# EAGLE design AquisitionBoardV2 (EAGLE 9.6.2)
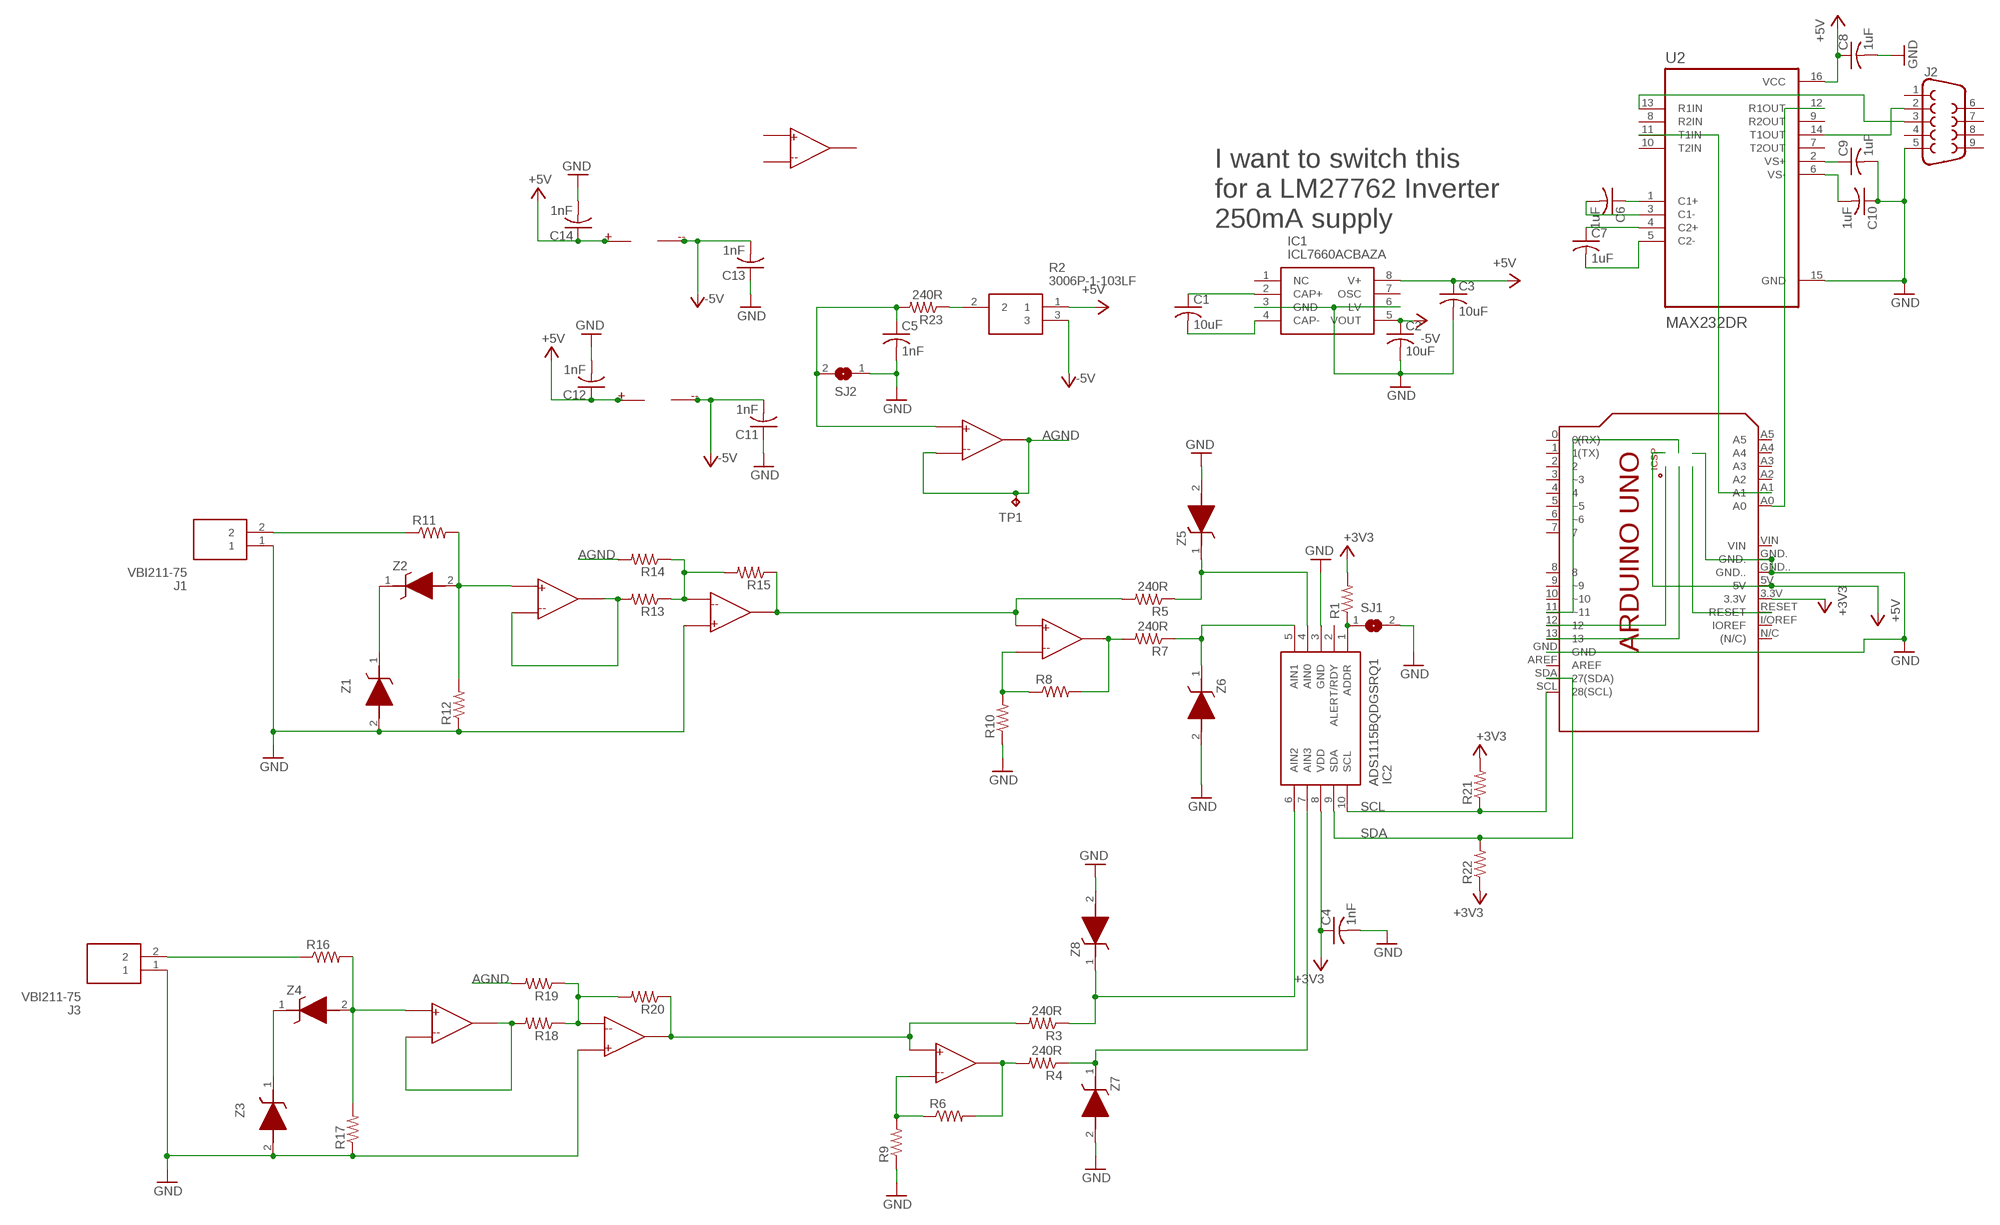
[diagram p0: schematic, sheet 1]

## Parts
C1  10uF  C-USC0603  [C0603]
C2  10uF  C-USC0603  [C0603]
C3  10uF  C-USC0603  [C0603]
C4  1nF  C-USC0603  [C0603]
C5  1nF  C-USC0603  [C0603]
C6  1uF  C-USC0603  [C0603]
C7  1uF  C-USC0603  [C0603]
C8  1uF  C-USC0603  [C0603]
C9  1uF  C-USC0603  [C0603]
C10  1uF  C-USC0603  [C0603]
C11  1nF  C-USC0603  [C0603]
C12  1nF  C-USC0603  [C0603]
C13  1nF  C-USC0603  [C0603]
C14  1nF  C-USC0603  [C0603]
IC1  ICL7660ACBAZA  [SOIC127P600X175-8N]
IC2  ADS1115BQDGSRQ1  [SOP50P490X110-10N]
J1  VBI211-75  [VBI21175]
J2  DB9MALE  [DB9_MALE]
J3  VBI211-75  [VBI21175]
PCB1  ARDUINO_UNO  [ARDUINO_UNO]
R1  R-US_R0805  [R0805]
R2  3006P-1-103LF  [3006P_1]
R3  240R  R-US_R0805  [R0805]
R4  240R  R-US_R0805  [R0805]
R5  240R  R-US_R0805  [R0805]
R6  R-US_R0805  [R0805]
R7  240R  R-US_R0805  [R0805]
R8  R-US_R0805  [R0805]
R9  R-US_R0805  [R0805]
R10  R-US_R0805  [R0805]
R11  R-US_R0805  [R0805]
R12  R-US_R0805  [R0805]
R13  R-US_R0805  [R0805]
R14  R-US_R0805  [R0805]
R15  R-US_R0805  [R0805]
R16  R-US_R0805  [R0805]
R17  R-US_R0805  [R0805]
R18  R-US_R0805  [R0805]
R19  R-US_R0805  [R0805]
R20  R-US_R0805  [R0805]
R21  R-US_R0805  [R0805]
R22  R-US_R0805  [R0805]
R23  240R  R-US_R0805  [R0805]
SJ1  SJ  [SJ]
SJ2  SJ  [SJ]
TP1  TPB1,27  [B1,27]
U2  MAX232DR  [SOIC127P600X175-16N]
U$1  OPA4227  [SOIC127P600X175-14N]
U$2  OPA4227  [SOIC127P600X175-14N]
Z1  CZRU52C4V7  [DIOM179X85N]
Z2  CZRU52C4V7  [DIOM179X85N]
Z3  CZRU52C4V7  [DIOM179X85N]
Z4  CZRU52C4V7  [DIOM179X85N]
Z5  CZRU52C4V7  [DIOM179X85N]
Z6  CZRU52C4V7  [DIOM179X85N]
Z7  CZRU52C4V7  [DIOM179X85N]
Z8  CZRU52C4V7  [DIOM179X85N]

## Nets
+3V3: C4.1 IC2.8(VDD) PCB1.3.3V R1.2 R21.2 R22.1
+5V: C3.1 C8.1 C12.1 C14.1 IC1.8(V+) PCB1.5V PCB1.+5V R2.1 U2.16(VCC) U$1.4(V+) U$2.4(V+)
-5V: C2.1 C11.2 C13.2 IC1.5(VOUT) R2.3 U$1.11(V-) U$2.11(V-)
AGND: R14.2 R19.2 TP1.TP U$2.6(A-) U$2.7(AO)
GND: C2.2 C3.2 C4.2 C5.2 C8.2 C9.2 C10.1 C11.1 C12.2 C13.1 C14.2 IC1.3(GND) IC1.6(LV) IC2.3(GND) J1.1 J2.5 J3.1 PCB1.GND PCB1.GND. PCB1.GND.. PCB1.GND_ R9.1 R10.1 R12.1 R17.1 SJ1.2 SJ2.1 U2.15(GND) U$1.5(A+) U$2.12(A+) Z1.2(A) Z3.2(A) Z5.2(A) Z6.2(A) Z7.2(A) Z8.2(A)
N$1: J1.2 R11.1
N$2: C1.1 IC1.2(CAP+)
N$3: C1.2 IC1.4(CAP-)
N$4: PCB1.RESET PCB1.RESET.
N$5: PCB1.13 PCB1.SCK
N$6: R2.2 R23.1
N$7: IC2.5(AIN1) R7.1 Z6.1(K)
N$8: IC2.4(AIN0) R5.1 Z5.1(K)
N$9: IC2.1(ADDR) R1.1 SJ1.1
N$10: C5.1 R23.2 SJ2.2 U$2.5(A+)
N$11: R5.2 R15.1 U$2.3(A+) U$2.14(AO)
N$12: R7.2 R8.2 U$2.1(AO)
N$14: R8.1 R10.2 U$2.2(A-)
N$15: IC2.6(AIN2) R3.1 Z8.1(K)
N$16: PCB1.12 PCB1.MISO
N$17: PCB1.11(~11) PCB1.MOSI
N$18: R11.2 R12.2 U$2.10(A+) Z2.2(A)
N$19: Z1.1(K) Z2.1(K)
N$20: J2.3 U2.13(R1IN)
N$21: R13.2 U$2.8(AO) U$2.9(A-)
N$22: R4.2 R6.2 U$1.8(AO)
N$23: R13.1 R14.1 R15.2 U$2.13(A-)
N$24: R6.1 R9.2 U$1.9(A-)
N$25: J2.2 U2.14(T1OUT)
N$26: J3.2 R16.1
N$27: R16.2 R17.2 U$1.3(A+) Z4.2(A)
N$28: Z3.1(K) Z4.1(K)
N$29: C6.1 U2.1(C1+)
N$30: C6.2 U2.3(C1-)
N$31: C7.1 U2.4(C2+)
N$32: C7.2 U2.5(C2-)
N$33: C9.1 U2.2(VS+)
N$34: C10.2 U2.6(VS-)
N$35: R18.2 U$1.1(AO) U$1.2(A-)
N$36: R18.1 R19.1 R20.2 U$1.6(A-)
N$37: R3.2 R20.1 U$1.7(AO) U$1.10(A+)
N$38: IC2.7(AIN3) R4.1 Z7.1(K)
N$39: PCB1.A0 U2.12(R1OUT)
N$40: PCB1.A1 U2.11(T1IN)
SCL: IC2.10(SCL) PCB1.SCL(28(SCL)) R21.1
SDA: IC2.9(SDA) PCB1.SDA(27(SDA)) R22.2
Unconnected: IC1.1(NC) IC1.7(OSC) IC2.2(ALERT/RDY) J2.1 J2.4 J2.6 J2.7 J2.8 J2.9 PCB1.0(0(RX)) PCB1.1(1(TX)) PCB1.2 PCB1.3(~3) PCB1.4 PCB1.5(~5) PCB1.6(~6) PCB1.7 PCB1.8 PCB1.9(~9) PCB1.10(~10) PCB1.A2 PCB1.A3 PCB1.A4 PCB1.A5 PCB1.AREF PCB1.I/OREF(IOREF) PCB1.N/C((N/C)) PCB1.VIN U2.7(T2OUT) U2.8(R2IN) U2.9(R2OUT) U2.10(T2IN) U$1.12(A+) U$1.13(A-) U$1.14(AO)

## Notes on the sheet
- I want to switch this
  for a LM27762 Inverter
  250mA supply

## Library data of the parts
C1-C14 = rcl:C-US: CAPACITOR, American symbol; SPICEPREFIX: C
IC1 = ICL7660ACBAZA:ICL7660ACBAZA: The ICL7660S and ICL7660A Super Voltage Converters are monolithic CMOS voltage conversion ICs that guarantee significant performance advantages over other similar devices. They are direct replacements for the industry standard ICL7660 offering an extended operating supply voltage range up to 12V, with lower supply current. A Frequency Boost pin has been incorporated to enable the user to achieve lower output impedance despite using smaller capacitors. All improvements are highlighted in the Electrical Spec Source: Datasheet <https://www.renesas.com/en-us/www/doc/datasheet/icl7660s-a.pdf>; DESCRIPTION: The ICL7660S and ICL7660A Super Voltage Converters are monolithic CMOS voltage conversion ICs that guarantee significant performance advantages over other similar devices. They are direct replacements for the industry standard ICL7660 offering an extended operating supply voltage range up to 12V, with lower supply current. A Frequency Boost pin has been incorporated to enable the user to achieve lower output impedance despite using smaller capacitors. All improvements are highlighted in the Electrical Spec; HEIGHT: 1.75mm; MANUFACTURER_NAME: Renesas Electronics; MANUFACTURER_PART_NUMBER: ICL7660ACBAZA; MOUSER_PART_NUMBER: 968-ICL7660ACBAZA; MOUSER_PRICE-STOCK: https://www.mouser.co.uk/ProductDetail/Renesas-Intersil/ICL7660ACBAZA?qs=9fLuogzTs8LeW4me0pfrFQ%3D%3D
IC2 = ADS1115BQDGSRQ1:ADS1115BQDGSRQ1: Automotive 16-Bit 860SPS 4-Ch Delta-Sigma ADC With PGA, Oscillator, VREF, Comparator, and I2C Source: Datasheet <http://www.ti.com/lit/gpn/ads1115-q1>; DESCRIPTION: Automotive 16-Bit 860SPS 4-Ch Delta-Sigma ADC With PGA, Oscillator, VREF, Comparator, and I2C; HEIGHT: 1.1mm; MANUFACTURER_NAME: Texas Instruments; MANUFACTURER_PART_NUMBER: ADS1115BQDGSRQ1; MOUSER_PART_NUMBER: 595-ADS1115BQDGSRQ1; MOUSER_PRICE-STOCK: https://www.mouser.co.uk/ProductDetail/Texas-Instruments/ADS1115BQDGSRQ1?qs=34RfhUjJmKdvyLrkbnfjHA%3D%3D
J1 J3 = VBI211-75:VBI211-75: RF Connectors / Coaxial Connectors BNC R/A PCB Mt Jack Source: Datasheet <https://www.mouser.mx/datasheet/2/643/dr-CCS-VIT-VBI211-75-1308996.pdf>; DESCRIPTION: RF Connectors / Coaxial Connectors BNC R/A PCB Mt Jack; HEIGHT: 13mm; MANUFACTURER_NAME: Cinch Connectivity Solutions; MANUFACTURER_PART_NUMBER: VBI211-75; MOUSER_PART_NUMBER: 530-VBI211-75; MOUSER_PRICE-STOCK: https://www.mouser.co.uk/ProductDetail/Vitelec-Cinch-Connectivity-Solutions/VBI211-75?qs=HAjLtCtd%252Bdatcts%2FKc37yQ%3D%3D
J2 = SparkFun-Connectors:DB9: DB9 Connector Standard DB9 (D-Sub 9) serial connector. Can be used for CAN bus as well as RS485 and RS232. Footprint production proven. Here is the female version connector we sell at SparkFun: 9 Pin Female Serial Connector - PCB Mount <https://www.sparkfun.com/products/429> (PRT-00429) This connector has been used on the following SparkFun products: SparkFun RS232 Shifter - SMD <https://www.sparkfun.com/products/449> (PRT-00449) SparkFun RS232 Shifter SMD (No DB9) <https://www.sparkfun.com/products/8780> (PRT-08780); PROD_ID: CONN-09904
PCB1 = E14_Arduino_revC:ARDUINO_UNO: Device for representing an Arduino Uno board with a footprint in an EAGLE design. Created by Dave Young for Element14. More EAGLE documentation at: http://www.element14.com/community/community/knode/cadsoft_eagle
R1 R3-R23 = rcl:R-US_: RESISTOR, American symbol; SPICEPREFIX: R
R2 = 3006P-1-103LF:3006P-1-103LF: 15 turn cermet trimmer,10K 19mm 750mW Bourns 3006 Series 15-Turn Through Hole Cermet Trimmer Resistor with Pin Terminations, 10k +/-10% 0.75W +/-100ppm/C Source: Datasheet <http://www.bourns.com/docs/Product-Datasheets/3006.pdf>; DESCRIPTION: 15 turn cermet trimmer,10K 19mm 750mW Bourns 3006 Series 15-Turn Through Hole Cermet Trimmer Resistor with Pin Terminations, 10k +/-10% 0.75W +/-100ppm/C; HEIGHT: mm; MANUFACTURER_NAME: Bourns; MANUFACTURER_PART_NUMBER: 3006P-1-103LF; MOUSER_PART_NUMBER: 652-3006P-1-103-LF; MOUSER_PRICE-STOCK: https://www.mouser.co.uk/ProductDetail/Bourns/3006P-1-103LF?qs=nlUCIKN74UBewXtW9dljOA%3D%3D
SJ1 SJ2 = jumper:SJ: SMD solder JUMPER
TP1 = testpad:TP: Test pad
U2 = MAX232DR:MAX232DR
U$1 U$2 = OPA4227UA_2K5:OPA4227
Z1-Z8 = CZRU52C4V7:CZRU52C4V7: COMCHIP TECHNOLOGY CZRU52C4V7 Zener Diode, 4.7V 150 mW SMT 2-Pin SOD-523F (0603) Source: Datasheet <https://datasheet.datasheetarchive.com/originals/distributors/Datasheets-DGA23/1545930.pdf>; DESCRIPTION: COMCHIP TECHNOLOGY CZRU52C4V7 Zener Diode, 4.7V 150 mW SMT 2-Pin SOD-523F (0603); HEIGHT: 0.85mm; MANUFACTURER_NAME: Comchip Technology; MANUFACTURER_PART_NUMBER: CZRU52C4V7; MOUSER_PART_NUMBER: 750-CZRU52C4V7; MOUSER_PRICE-STOCK: https://www.mouser.co.uk/ProductDetail/Comchip-Technology/CZRU52C4V7?qs=tw%252BuQ%2FB6PO1RrR6kVnXLIA%3D%3D

## Board
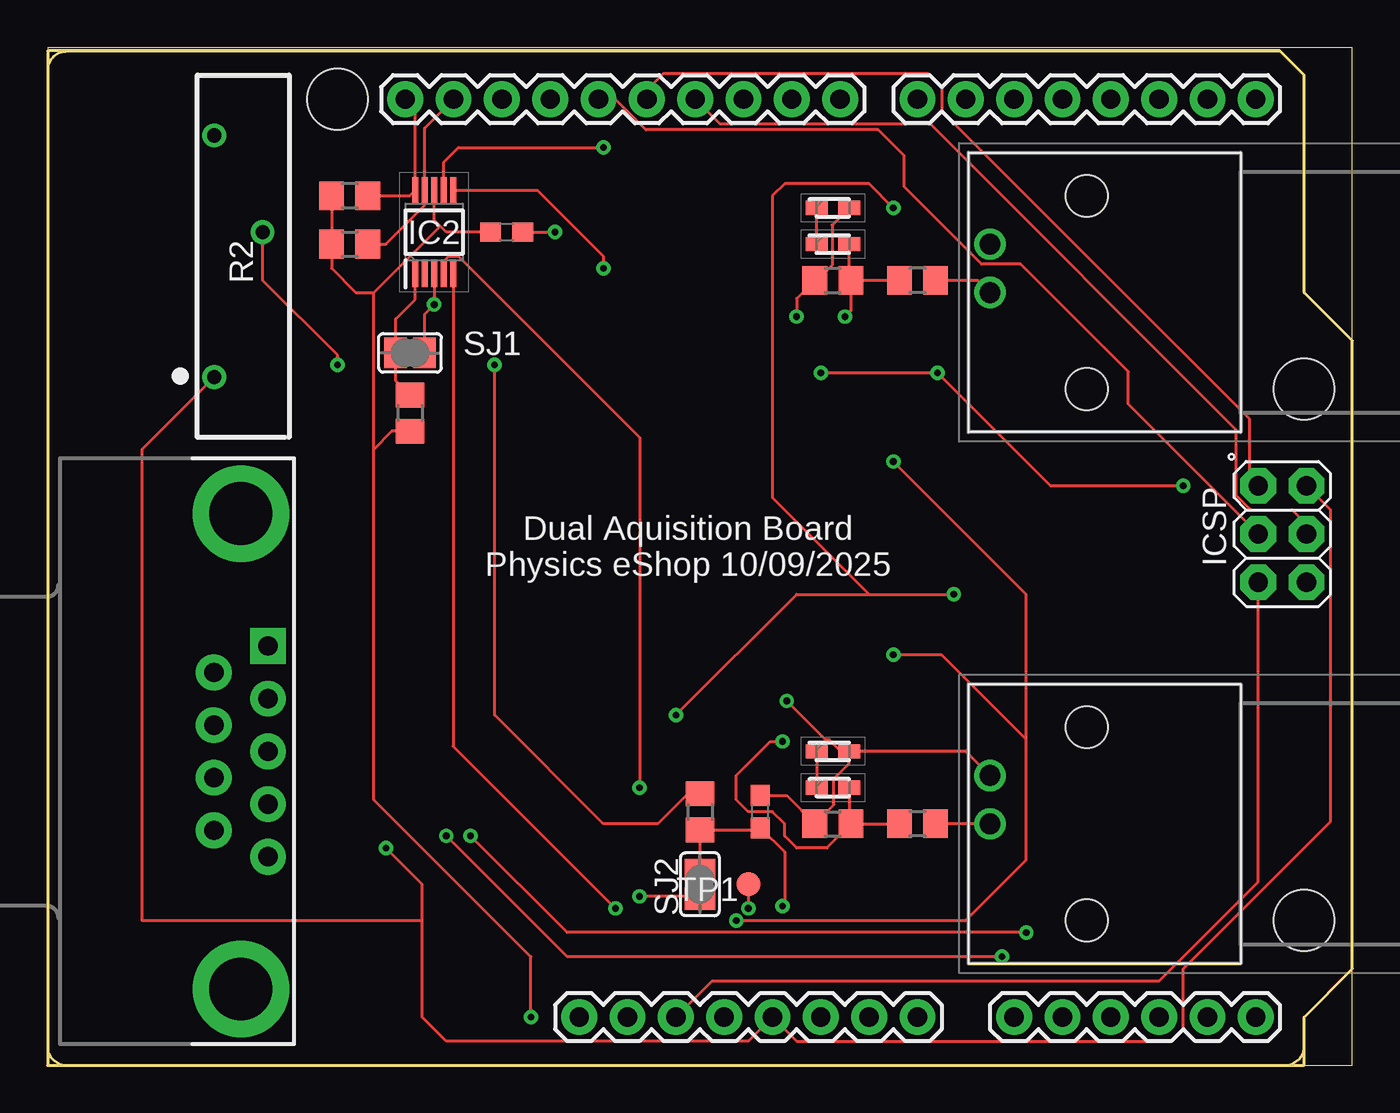
[diagram p1: board, top side]
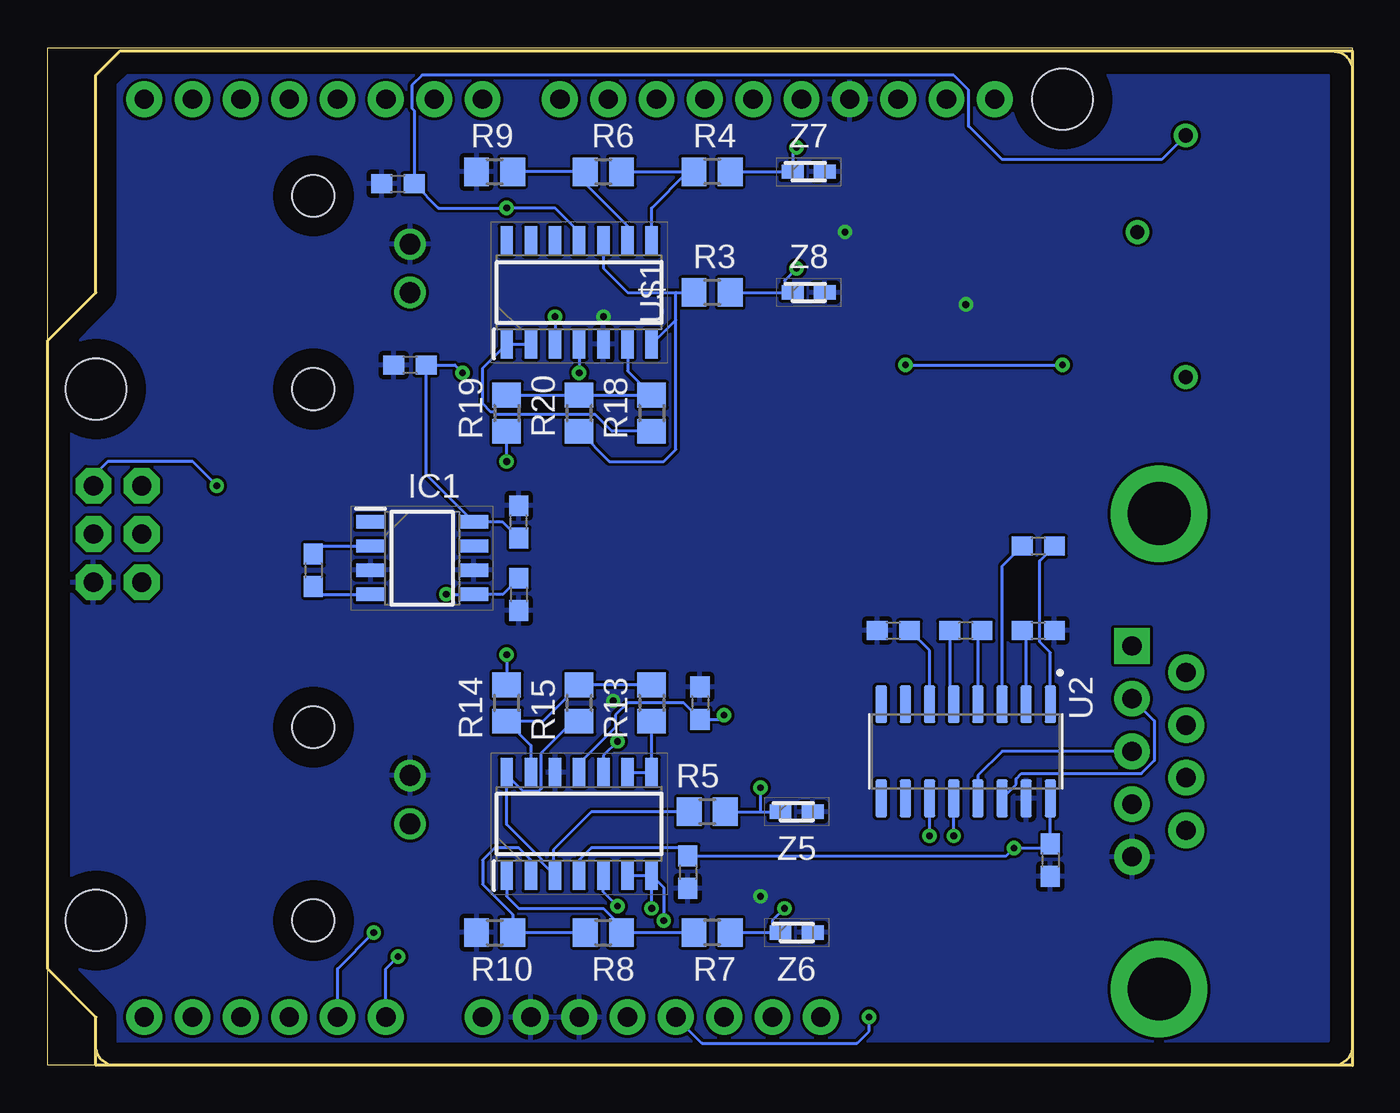
[diagram p2: board, bottom side, seen from below]

Size 68.58 x 53.52 mm. Coordinates in mm from the lower left corner, seen from the top.
Outline: 0,0 68.56,0 68.56,53.52 0,53.52 0,0
Outline: 0,0 66.04,0 66.04,2.54 68.58,5.08 68.58,38.1 66.04,40.64 66.04,52.07 64.77,53.34 0,53.34 0,0
Copper layers (1*16): Top 0.035mm / dielectric 1.5mm / Bottom 0.035mm
Design rules "default *": minimum track width 6mil, minimum drill 0.35mm, track to track 6mil, track to pad 6mil, pad to pad 6mil, via to via 6mil, smd to smd 6mil, copper to edge 40mil, drill to drill 6mil, minimum pad ring 10mil, minimum via ring 8mil, stop-mask expansion 4mil, vias tented up to drill 14mil, thermal gap 10mil

### Footprints (pad centres in the part's own frame; a part is rotated, then mirrored left to right if it is on the bottom)
C0603 = smd 1.1 x 1: 1 -0.85,0; 2 0.85,0
SOIC127P600X175-8N = smd 1.525 x 0.7: 1 -2.712,1.905; 2 -2.712,0.635; 3 -2.712,-0.635; 4 -2.712,-1.905; 5 2.712,-1.905; 6 2.712,-0.635; 7 2.712,0.635; 8 2.712,1.905
SOP50P490X110-10N = smd 1.4 x 0.3: 1 -2.2,1; 2 -2.2,0.5; 3 -2.2,0; 4 -2.2,-0.5; 5 -2.2,-1; 6 2.2,-1; 7 2.2,-0.5; 8 2.2,0; 9 2.2,0.5; 10 2.2,1
VBI21175 = drill 1.1 pad 1.65: 1 0,0; 2 2.54,0 | hole 2.2: -2.54,5.08; 7.62,5.08
DB9_MALE = drill 1.016 pad 1.88 square: 1 5.54,-1.42 | drill 1.016 pad 1.88: 2 2.77,-1.42; 3 0,-1.42; 4 -2.77,-1.42; 5 -5.54,-1.42; 6 4.15,1.42; 7 1.38,1.42; 8 -1.38,1.42; 9 -4.15,1.42 | drill 3.302 pad 5.08: G1 -12.5,0; G2 12.5,0
ARDUINO_UNO = drill 1.016 pad 1.88: 0 63.5,50.8; 1 60.96,50.8; 2 58.42,50.8; 3 55.88,50.8; 3.3V 35.56,2.54; 4 53.34,50.8; 5 50.8,50.8; 5V 38.1,2.54; 6 48.26,50.8; 7 45.72,50.8; 8 41.656,50.8; 9 39.116,50.8; 10 36.576,50.8; 11 34.036,50.8; 12 31.496,50.8; 13 28.956,50.8; A0 50.8,2.54; A1 53.34,2.54; A2 55.88,2.54; A3 58.42,2.54; A4 60.96,2.54; A5 63.5,2.54; AREF 23.876,50.8; GND 26.416,50.8; GND. 43.18,2.54; GND.. 40.64,2.54; I/OREF 30.48,2.54; N/C 27.94,2.54; RESET 33.02,2.54; SCL 18.796,50.8; SDA 21.336,50.8; VIN 45.72,2.54 | drill 1.016 pad 1.88 octagon: +5V 66.167,30.48; GND_ 66.167,25.4; MISO 63.627,30.48; MOSI 66.167,27.94; RESET. 63.627,25.4; SCK 63.627,27.94 | hole 3.2: 66.04,7.62; 66.04,35.56; 15.24,50.8
R0805 = smd 1.3 x 1.5: 1 -0.95,0; 2 0.95,0
3006P_1 = drill 0.74 pad 1.24: 1 3.175,3.94; 2 10.795,1.4; 3 15.875,3.94
SJ = smd 1.168 x 1.6: 1 -0.762,0; 2 0.762,0
B1,27 = smd 1.27 x 1.27: TP 0,0
SOIC127P600X175-16N = smd 1.97 x 0.6: 1 -2.475,4.445; 2 -2.475,3.175; 3 -2.475,1.905; 4 -2.475,0.635; 5 -2.475,-0.635; 6 -2.475,-1.905; 7 -2.475,-3.175; 8 -2.475,-4.445; 9 2.475,-4.445; 10 2.475,-3.175; 11 2.475,-1.905; 12 2.475,-0.635; 13 2.475,0.635; 14 2.475,1.905; 15 2.475,3.175; 16 2.475,4.445
SOIC127P600X175-14N = smd 1.525 x 0.65: 1 -2.712,3.81; 2 -2.712,2.54; 3 -2.712,1.27; 4 -2.712,0; 5 -2.712,-1.27; 6 -2.712,-2.54; 7 -2.712,-3.81; 8 2.712,-3.81; 9 2.712,-2.54; 10 2.712,-1.27; 11 2.712,0; 12 2.712,1.27; 13 2.712,2.54; 14 2.712,3.81
DIOM179X85N = smd 1.15 x 0.75: 1 -0.85,0; 2 0.85,0

### Placement (x,y rotation side)
C1  54.61,26.04 270 bottom
C2  43.81,24.77 270 bottom
C3  43.81,28.57 90 bottom
C4  24.13,43.81 0 top
C5  37.47,13.34 90 top
C6  16.51,27.3 180 bottom
C7  20.32,22.86 180 bottom
C8  15.88,10.79 270 bottom
C9  16.51,22.86 0 bottom
C10  24.13,22.86 0 bottom
C11  34.29,19.05 270 bottom
C12  34.92,10.16 270 bottom
C13  50.16,46.35 0 bottom
C14  49.53,36.83 180 bottom
IC1  48.9,26.67 0 bottom
IC2  20.32,43.81 90 top
J1  49.53,15.24 270 top
J2  10.16,16.51 90 top
J3  49.53,43.18 270 top
PCB1  0,0 0 top
R1  19.05,34.29 270 top
R2  12.7,33.02 90 top
R3  33.66,40.64 180 bottom
R4  33.66,46.99 180 bottom
R5  33.91,13.34 180 bottom
R6  39.37,46.99 0 bottom
R7  33.66,6.99 180 bottom
R8  39.37,6.99 0 bottom
R9  45.09,46.99 0 bottom
R10  45.09,6.99 0 bottom
R11  45.72,12.7 180 top
R12  41.27,12.7 0 top
R13  36.83,19.05 270 bottom
R14  44.45,19.05 90 bottom
R15  40.64,19.05 90 bottom
R16  45.72,41.27 180 top
R17  41.27,41.27 0 top
R18  36.83,34.29 270 bottom
R19  44.45,34.29 270 bottom
R20  40.64,34.29 90 bottom
R21  15.88,45.72 180 top
R22  15.88,43.18 0 top
R23  34.29,13.34 270 top
SJ1  19.05,37.47 0 top
SJ2  34.29,9.53 90 top
TP1  36.83,9.53 0 top
U2  20.32,16.51 270 bottom
U$1  40.64,40.64 90 bottom
U$2  40.64,12.7 90 bottom
Z1  41.27,16.51 0 top
Z2  41.27,14.61 0 top
Z3  41.27,45.09 0 top
Z4  41.27,43.18 0 top
Z5  29.21,13.34 0 bottom
Z6  29.21,6.99 0 bottom
Z7  28.57,46.99 0 bottom
Z8  28.57,40.64 0 bottom

### Tracks (layer width: path | path; a pad name or v marks a point on that pad's centre or on a via)
+3V3  (via drill 0.35)
  Top 0.152: v25.4,2.54 25.4,5.71 17.14,13.97 17.14,32.38 | 17.14,32.38 17.14,40.64 | 17.14,40.64 20.64,44.13 | IC2.8 20.32,44.45 20.64,44.13 | R21.2 R22.1 14.93,41.91 16.2,40.64 17.14,40.64 | C4.1 20.95,43.81 20.64,44.13 | R1.2 18.1,33.34 17.14,32.38
  Bottom 0.152: PCB1.3.3V 34.19,1.17 26.04,1.17 25.4,1.8 v25.4,2.54
+5V  (via drill 0.35)
  Top 0.152: PCB1.+5V 67.41,29.23 67.41,12.8 59.69,5.08 59.69,1.91 59.05,1.27 39.37,1.27 PCB1.5V 36.83,1.27 20.95,1.27 19.68,2.54 19.68,7.62 | v17.78,11.43 19.68,9.53 19.68,7.62 | v40.64,36.42 v46.76,36.42 52.7,30.48 v59.69,30.48 | R2.1 4.95,32.38 4.95,7.62 19.68,7.62
  Bottom 0.152: U2.16 C8.1 16.09,11.43 v17.78,11.43 18.2,11.01 C12.1 35.34,11.43 40.01,11.43 40.64,10.79 U$2.4 | U$1.4 v40.64,36.42 | v59.69,30.48 60.96,31.75 65.41,31.75 66.17,30.99 PCB1.+5V | v46.76,36.42 47.17,36.83 C14.1 48.68,31.07 IC1.8 44.66,28.57 C3.1
-5V  (via drill 0.35)
  Top 0.152: v44.45,45.09 43.18,46.35 38.73,46.35 38.1,45.72 38.1,29.84 43.18,24.77 | 43.18,24.77 v47.62,24.77 | v33.02,18.41 39.37,24.77 43.18,24.77
  Bottom 0.152: U$1.11 40.64,43.81 41.91,45.09 v44.45,45.09 48.05,45.09 C13.2 49.31,50.2 49.43,50.32 49.43,51.54 48.9,52.07 20.95,52.07 20.85,51.97 20.17,51.28 20.17,49.38 18.41,47.62 10.03,47.62 R2.3 | U$2.11 40.64,15.88 38.73,17.78 38.73,18.41 38.1,19.05 35.14,19.05 C11.2 33.23,18.2 v33.02,18.41 | C2.1 44.66,24.77 IC1.5 v47.62,24.77
AGND  (via drill 0.35)
  Top 0.152: TP1.TP v36.83,8.26 | 51.44,17.14 51.44,10.79 48.26,7.62 v36.2,7.62 | 51.44,17.14 46.99,21.59 v44.45,21.59 | 51.44,17.14 51.44,24.77 v44.45,31.75
  Bottom 0.152: U$2.6 U$2.7 | v36.83,8.26 U$2.7 | U$2.7 36.2,9.35 v36.2,7.62 | v44.45,21.59 R14.2 | v44.45,31.75 R19.2
GND  (via drill 0.35)
  Top 0.152: Z3.2 41.23,44.19 41.23,42.08 40.43,41.27 R17.1 39.37,40.32 v39.37,39.37 | Z1.2 42.12,15.88 41.32,15.07 41.32,13.7 R12.1 38.84,14.19 C5.2 | J1.1 48.26,16.51 Z1.2 | IC2.3 v20.32,40.01 19.81,39.5 SJ1.2 | C4.2 v26.67,43.81 | v38.85,19.16 40.9,17.11 41.09,17.11 41.7,16.51 Z1.2 | SJ2.1 34.16,8.89 v31.11,8.89
  pour Bottom: 1.27,1.27 67.31,1.27 67.31,52.07 1.27,52.07
N$1
  Top 0.152: J1.2 R11.1
N$2
  Bottom 0.152: C1.1 54.19,27.3 IC1.2
N$3
  Bottom 0.152: C1.2 54.19,24.77 IC1.4
N$4
  Top 0.152: PCB1.RESET 34.92,4.45 58.42,4.45 63.63,9.65 PCB1.RESET.
N$5
  Top 0.152: PCB1.SCK 56.8,34.77 56.8,36.47 51.14,42.13 49.09,42.13 45.01,46.2 45.01,47.84 43.65,49.2 31.45,49.2 29.84,50.8 PCB1.13
N$6  (via drill 0.35)
  Top 0.152: R23.1 33.66,14.29 32.07,12.7 29.21,12.7 23.5,18.41 v23.5,36.83 | v15.24,36.83 15.24,37.34 11.3,41.27 R2.2
  Bottom 0.152: v23.5,36.83 v15.24,36.83
N$7  (via drill 0.35)
  Top 0.152: IC2.5 21.32,16.78 v29.84,8.26
  Bottom 0.152: R7.1 30.48,6.99 | 30.48,6.99 Z6.1 | v29.84,8.26 30.48,7.62 30.48,6.99
N$8  (via drill 0.35)
  Top 0.152: IC2.4 20.82,42.29 21.07,42.54 21.59,42.54 21.59,42.55 31.11,33.02 v31.11,14.61
  Bottom 0.152: R5.1 31.11,13.34 | 31.11,13.34 Z5.1 | v31.11,14.61 31.11,13.34
N$9
  Top 0.152: R1.1 18.29,36 SJ1.1 18.29,39.24 19.32,40.27 IC2.1
N$10  (via drill 0.35)
  Top 0.152: v38.62,8.37 38.73,8.48 38.73,11.21 C5.1 37.37,12.38 R23.2 SJ2.2
  Bottom 0.152: v38.62,8.37 39.37,9.11 U$2.5
N$11
  Bottom 0.152: R15.1 40.95,18.1 42.63,16.43 42.63,14.55 42.76,14.42 43.6,14.42 44.37,15.19 44.37,15.33 U$2.14 44.45,12.67 42.63,10.85 42.63,10.7 42,10.07 | U$2.3 42,10.07 | R5.2 40.01,13.34 42,11.34 42,10.07
N$12
  Bottom 0.152: U$2.1 44.45,8.89 43.81,8.26 39.37,8.26 38.42,7.3 R8.2 R7.2
N$14
  Bottom 0.152: R8.1 R10.2 44.13,7.94 45.72,9.53 45.72,10.79 45.09,11.43 43.81,11.43 43.18,10.79 U$2.2
N$15  (via drill 0.35)
  Top 0.152: IC2.6 25.74,46.02 29.21,42.55 v29.21,41.91
  Bottom 0.152: R3.1 29.84,40.64 | 29.84,40.64 Z8.1 | v29.21,41.91 29.84,41.27 29.84,40.64
N$16
  Top 0.152: PCB1.12 31.5,51.27 32.38,52.16 46.27,52.16 46.99,51.44 46.99,50.16 63.18,33.97 63.18,30.92 PCB1.MISO
N$17
  Top 0.152: PCB1.11 35.33,49.5 46.38,49.5 62.46,33.43 62.46,30 63.24,29.21 65.41,29.21 66.17,28.45 PCB1.MOSI
N$18  (via drill 0.35)
  Top 0.152: R12.2 42.12,12.8 Z2.2 | R12.2 R11.2 | R12.2 40.95,11.43 39.37,11.43 38.73,12.06 38.73,12.7 38.1,13.34 36.83,13.34 36.2,13.97 36.2,15.24 37.99,17.03 v38.62,17.03
  Bottom 0.152: v38.62,17.03 39.37,16.29 U$2.10
N$19
  Top 0.152: Z1.1 Z2.1
N$20
  Bottom 0.152: J2.3 18.41,16.51 19.68,15.24 U2.13
N$21
  Bottom 0.152: U$2.9 U$2.8 R13.2
N$22
  Bottom 0.152: R4.2 34.92,46.99 | U$1.8 36.83,45.09 34.92,46.99 | R6.2 34.92,46.99
N$23
  Bottom 0.152: R13.1 R15.2 42.54,18.1 R14.1 43.18,16.83 U$2.13
N$24
  Bottom 0.152: U$1.9 38.1,44.13 40.32,46.35 R6.1 R9.2
N$25
  Bottom 0.152: U2.14 17.67,14.78 17.67,15.07 17.4,15.34 11.1,15.34 10.41,16.03 10.41,18.11 J2.2
N$26
  Top 0.152: J3.2 48.9,41.27 R16.1
N$27  (via drill 0.35)
  Top 0.152: R16.2 R17.2 | R17.2 42.12,41.38 Z4.2 | R17.2 42.23,39.69 v41.91,39.37
  Bottom 0.152: v41.91,39.37 U$1.3
N$28
  Top 0.152: Z4.1 Z3.1
N$29
  Bottom 0.152: U2.1 15.88,21.7 16.44,22.27 16.44,26.53 C6.1
N$30
  Bottom 0.152: U2.3 18.41,26.25 C6.2
N$31
  Bottom 0.152: C7.1 19.68,22.64 U2.4
N$32
  Bottom 0.152: C7.2 21.17,19.2 U2.5
N$33
  Bottom 0.152: U2.2 17.14,22.64 C9.1
N$34
  Bottom 0.152: U2.6 22.23,21.8 C10.2
N$35
  Bottom 0.152: U$1.2 U$1.1 45.72,36.66 45.72,34.79 45.3,34.36 45.16,34.36 45.01,34.22 39.8,34.22 38.92,33.34 R18.2
N$36
  Bottom 0.152: R19.1 R20.2 R18.1 38.1,36.51 U$1.6
N$37
  Bottom 0.152: U$1.10 39.37,41.91 38.1,40.64 35.56,40.64 | 35.56,40.64 R3.2 | R20.1 39.05,31.75 36.2,31.75 35.56,32.38 35.56,39.2 | U$1.7 35.56,39.2 | 35.56,39.2 35.56,40.64
N$38  (via drill 0.35)
  Top 0.152: IC2.7 20.82,47.49 21.59,48.26 v29.21,48.26
  Bottom 0.152: R4.1 Z7.1 29.43,48.05 v29.21,48.26
N$39  (via drill 0.35)
  Top 0.152: v50.16,5.71 27.3,5.71 v20.95,12.06
  Bottom 0.152: PCB1.A0 50.8,5.08 v50.16,5.71 | v20.95,12.06 U2.12
N$40  (via drill 0.35)
  Top 0.152: v51.44,6.99 27.3,6.99 v22.23,12.06
  Bottom 0.152: PCB1.A1 53.34,5.08 v51.44,6.99 | v22.23,12.06 U2.11
SCL
  Top 0.152: PCB1.SCL 19.32,50.28 IC2.10 19.02,45.72 R21.1
SDA
  Top 0.152: PCB1.SDA 19.82,49.28 IC2.9 19.82,45.22 17.78,43.18 R22.2

### Text on the board
tPlace: Dual Aquisition Board / Physics eShop 10/09/2025